# Altium schematic sheet УШЯИ.411618.029Э Э3 Лист 6new.schdoc
size 594 x 420 mm; SheetNumber: 6; SheetTotal: 7
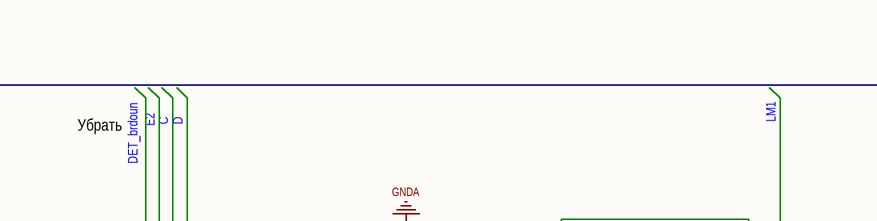
[diagram p0: УШЯИ.411618.029Э Э3 Лист 6new.schdoc, top right]
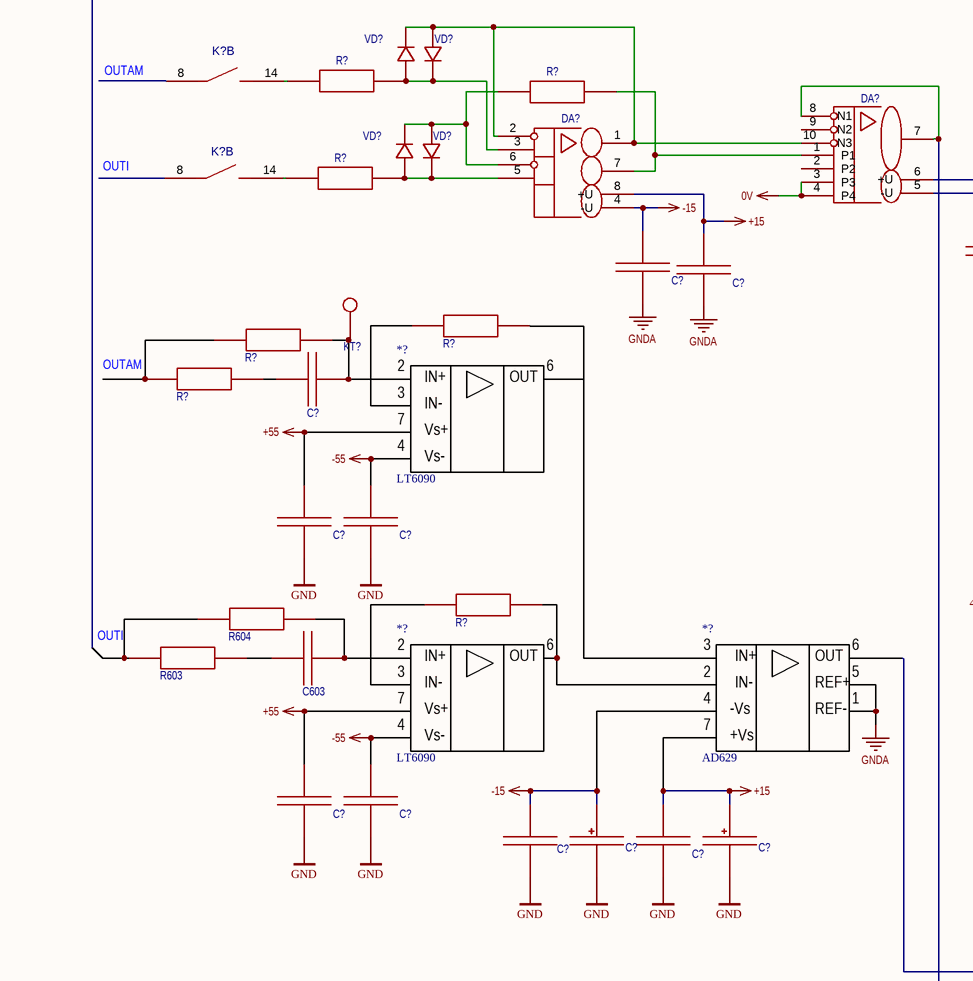
[diagram p1: УШЯИ.411618.029Э Э3 Лист 6new.schdoc, bottom left]
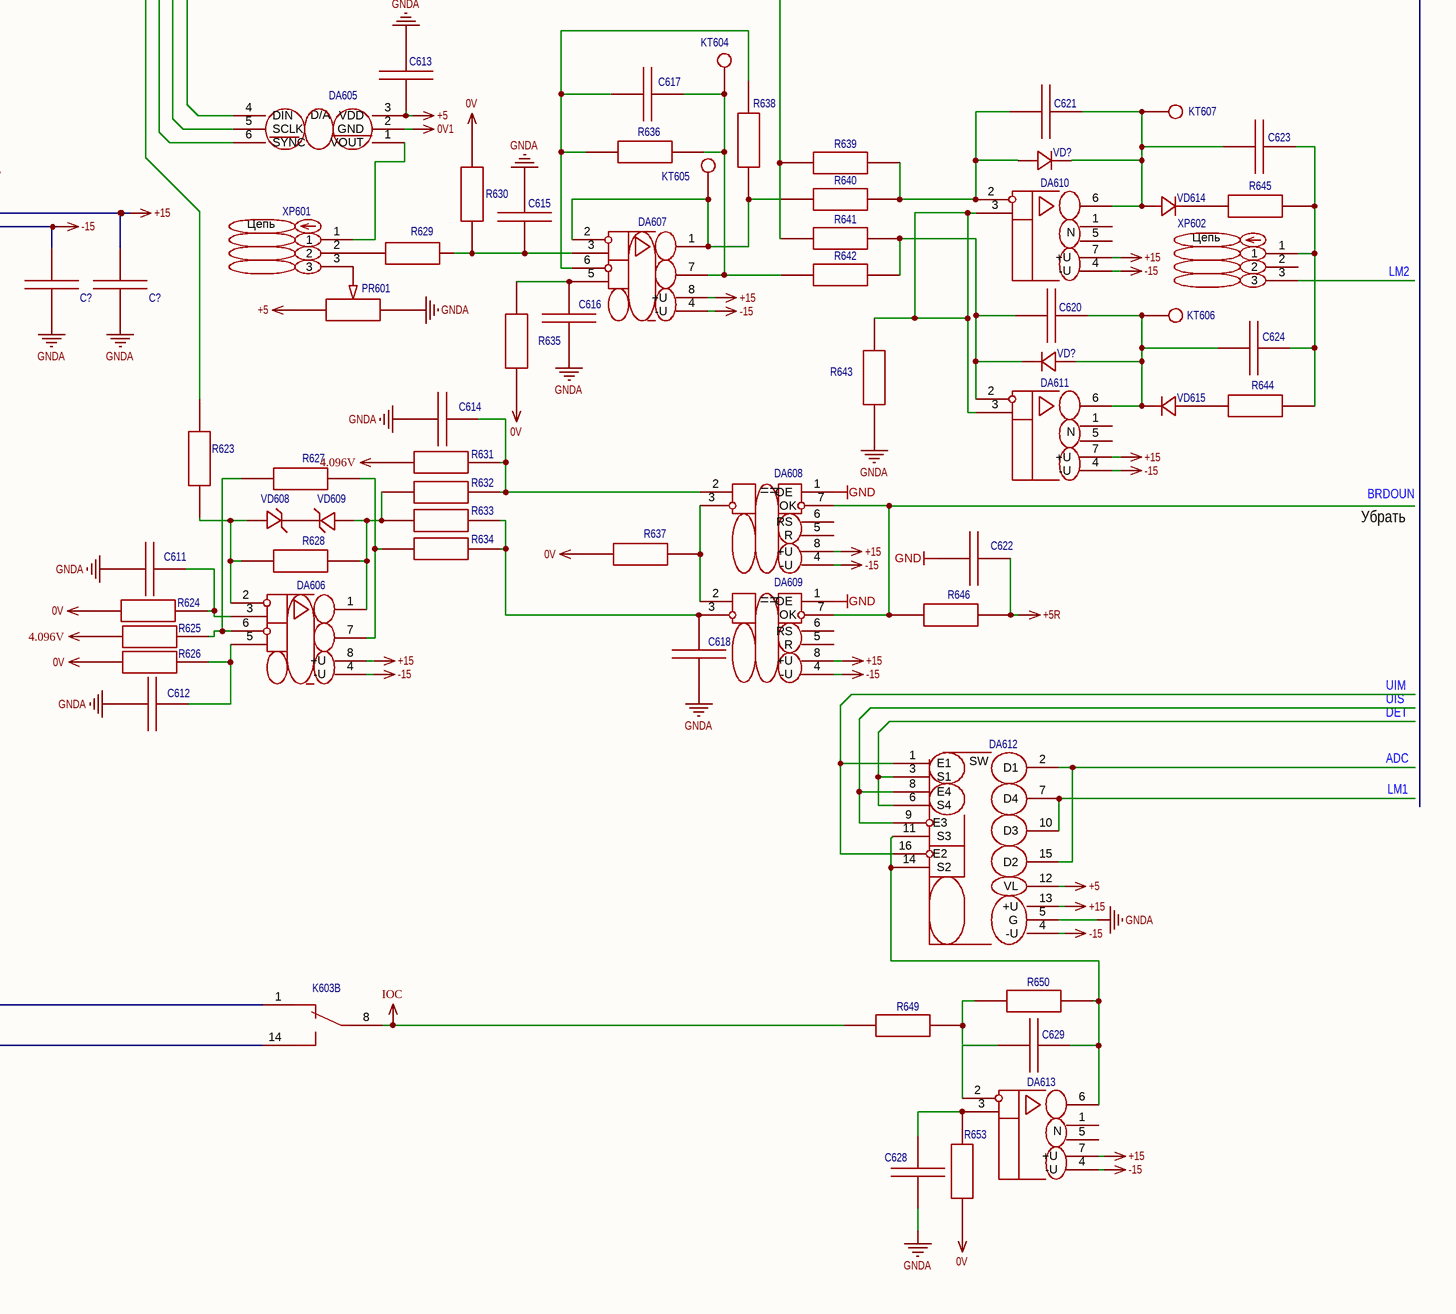
[diagram p2: УШЯИ.411618.029Э Э3 Лист 6new.schdoc, bottom right]

## Parts
(Parts that share a designator on the sheet are numbered #1, #2 ... from top to bottom, then left to right.)
*?#1  LT6090
*?#2  LT6090
*?#3  AD629
C603  Конденсатор SMD 15пФ 100В X7R 10% [0805]  [C0805]  (value not drawn)
C611  Конденсатор SMD 9100пФ 100В X7R 10% [1206]  [C0805]  (value not drawn)
C612  Конденсатор SMD 9100пФ 100В X7R 10% [1206]  [C0805]  (value not drawn)
C613  Конденсатор SMD 0,33мкФ 100В X7R 10% [0805]  [C0805]  (value not drawn)
C614  Конденсатор SMD 0,33мкФ 100В X7R 10% [0805]  [C0805]  (value not drawn)
C615  Конденсатор SMD 9100пФ 100В X7R 10% [0805]  [C0805]  (value not drawn)
C616  Конденсатор SMD 9100пФ 100В X7R 10% [0805]  [C0805]  (value not drawn)
C617  Конденсатор SMD 33пФ 100В X7R 10% [0805]  [C0805]  (value not drawn)
C618  Конденсатор SMD 9100пФ 100В X7R 10% [1206]  [C1206]  (value not drawn)
C620  Конденсатор SMD 680пФ 100В X7R 10% [0805]  [C0805]  (value not drawn)
C621  Конденсатор SMD 680пФ 100В X7R 10% [0805]  [C0805]  (value not drawn)
C622  Конденсатор SMD 0,33мкФ 100В X7R 10% [0805]  [C0805]  (value not drawn)
C623  Конденсатор SMD 100нФ В X7R 10% [0805]  [C0805]  (value not drawn)
C624  Конденсатор SMD 100нФ В X7R 10% [0805]  [C0805]  (value not drawn)
C628  Конденсатор SMD 51пФ 100В X7R 10% [0805]  [C0805]  (value not drawn)
C629  Конденсатор SMD 33пФ 100В X7R 10% [0805]  [C0805]  (value not drawn)
C?#1  Конденсатор SMD 0.1мкФ 100В X7R 10% [0805]  [C0805]  (value not drawn)
C?#2  Конденсатор SMD 0.1мкФ 100В X7R 10% [0805]  [C0805]  (value not drawn)
C?#3  Конденсатор SMD 0.1мкФ 100В X7R 10% [0805]  [C0805]  (value not drawn)
C?#4  Конденсатор SMD 0.1мкФ 100В X7R 10% [0805]  [C0805]  (value not drawn)
C?#5  Конденсатор SMD 15пФ 100В X7R 10% [0805]  [C0805]  (value not drawn)
C?#6  Конденсатор SMD 0.1мкФ 100В X7R 10% [0805]  [C0805]  (value not drawn)
C?#7  Конденсатор SMD 0.1мкФ 100В X7R 10% [0805]  [C0805]  (value not drawn)
C?#8  Конденсатор SMD 0.1мкФ 100В X7R 10% [0805]  [C0805]  (value not drawn)
C?#9  Конденсатор SMD 0.1мкФ 100В X7R 10% [0805]  [C0805]  (value not drawn)
C?#10  Конденсатор SMD 1мкФ 100В X7R 10% [0805]  [C0805]  (value not drawn)
C?#11  ECAP (К50-35), 10мкФ, 100В, 105°C, 5x11, p:2мм  [CAP-TH_BD5.0-P2.00-D0.8-FD]  (value not drawn)
C?#12  Конденсатор SMD 1мкФ 100В X7R 10% [0805]  [C0805]  (value not drawn)
C?#13  ECAP (К50-35), 10мкФ, 100В, 105°C, 5x11, p:2мм  [CAP-TH_BD5.0-P2.00-D0.8-FD]  (value not drawn)
DA605  Цифроаналоговый преобразователь AD5300BRTZ [SOT-23-6]  [SOT-23-6_L2.9-W1.6-P0.95-LS2.8-BL]  (value not drawn)
DA606  Операционный усилитель AD8672ARZ [SOIC-8]  [SOIC-8_L4.9-W3.9-P1.27-LS6.0-BL]  (value not drawn)
DA607  Операционный усилитель AD8672ARZ [SOIC-8]  [SOIC-8_L4.9-W3.9-P1.27-LS6.0-BL]  (value not drawn)
DA608  Компаратор КР554СА3А [DIP-8]  [DIP-8_L9.7-W6.4-P2.54-LS7.6-BL-1]  (value not drawn)
DA609  Компаратор КР554СА3А [DIP-8]  [DIP-8_L9.7-W6.4-P2.54-LS7.6-BL-1]  (value not drawn)
DA610  Операционный усилитель ADA4627-1BRZ [SOIC-8]  [SOIC-8_L5.0-W4.0-P1.27-LS6.1-BL]  (value not drawn)
DA611  Операционный усилитель ADA4627-1BRZ [SOIC-8]  [SOIC-8_L5.0-W4.0-P1.27-LS6.1-BL]  (value not drawn)
DA612  Коммутатор аналоговых сигналов ADG433BRZ [SOIC-16]  [SOIC-16_L9.9-W3.9-P1.27-LS6.0-BL]  (value not drawn)
DA613  Операционный усилитель ADA4627-1BRZ [SOIC-8]  [SOIC-8_L5.0-W4.0-P1.27-LS6.1-BL]  (value not drawn)
DA?#1  Операционный усилитель AD8271 [MSOP-10]  [MSOP-10_L3.0-W3.0-P0.50-LS5.0-BL]  (value not drawn)
DA?#2  Операционный усилитель AD8512ARZ [SOIC-8]  [SOIC-8_L4.9-W3.9-P1.27-LS6.0-BL]  (value not drawn)
K603  Реле герконовое DIP05-1C90-51L [PCB]  [Реле герконовое DIP05-1C90-51L [PCB]]  (value not drawn)  (part B of 2)
K?#1  Реле герконовое DIP05-1A72-13L  [PCB]  [Реле герконовое DIP05-1A72-13L  [PCB]]  (value not drawn)  (part B of 2)
K?#2  Реле герконовое DIP05-1A72-13L  [PCB]  [Реле герконовое DIP05-1A72-13L  [PCB]]  (value not drawn)  (part B of 2)
KT604  Control point  (value not drawn)
KT605  Control point  (value not drawn)
KT606  Control point  (value not drawn)
KT607  Control point  (value not drawn)
KT?  Control point  (value not drawn)
PR601  47кОм  [RES-ADJ-TH_3329H]  (value not drawn)
R603  Резистор 5,1кОм 0,125Вт 1% [0805]  [R0805]  (value not drawn)
R604  Резистор 301кОм 0.25Вт 1% [1206]  [R1206]  (value not drawn)
R623  Резистор 10кОм 0.25Вт 1% [1206]  [R1206]  (value not drawn)
R624  Резистор 10кОм 0.25Вт 1% [1206]  [R1206]  (value not drawn)
R625  Резистор 10кОм 0.25Вт 1% [1206]  [R1206]  (value not drawn)
R626  Резистор 10кОм 0.25Вт 1% [1206]  [R1206]  (value not drawn)
R627  Резистор 10кОм 0,125Вт 1% [0805]  [R0805]  (value not drawn)
R628  Резистор 10кОм 0,125Вт 1% [0805]  [R0805]  (value not drawn)
R629  Резистор 470Ом 0,125Вт 1% [0805]  [R0805]  (value not drawn)
R630  Резистор 12кОм 0,125Вт 1% [0805]  [R0805]  (value not drawn)
R631  Резистор 10кОм 0.25Вт 1% [1206]  [R1206]  (value not drawn)
R632  Резистор 17,2кОм 0.25Вт 1% [1206]  [R1206]  (value not drawn)
R633  Резистор 17,2кОм 0.25Вт 1% [1206]  [R1206]  (value not drawn)
R634  Резистор 10кОм 0.25Вт 1% [1206]  [R1206]  (value not drawn)
R635  Резистор 12кОм 0,125Вт 1% [0805]  [R0805]  (value not drawn)
R636  Резистор 10кОм 0.25Вт 1% [0805]  [R0805]  (value not drawn)
R637  Резистор 5,1кОм 0,125Вт 1% [0805]  [R0805]  (value not drawn)
R638  Резистор 10кОм 0.25Вт 1% [1206]  [R1206]  (value not drawn)
R639  Резистор 4,99кОм 0.25Вт 1% [1206]  [R1206]  (value not drawn)
R640  Резистор 10кОм 0.25Вт 1% [1206]  [R1206]  (value not drawn)
R641  Резистор 4,99кОм 0.25Вт 1% [1206]  [R1206]  (value not drawn)
R642  Резистор 10кОм 0.25Вт 1% [1206]  [R1206]  (value not drawn)
R643  Резистор 24кОм 0,125Вт 1% [0805]  [R0805]  (value not drawn)
R644  Резистор 4,7кОм 0,125Вт 1% [0805]  [R0805]  (value not drawn)
R645  Резистор 4,7кОм 0,125Вт 1% [0805]  [R0805]  (value not drawn)
R646  Резистор 12кОм 0,125Вт 1% [0805]  [R0805]  (value not drawn)
R649  Резистор 2кОм 0.25Вт 1% [1206]  [R1206]  (value not drawn)
R650  Резистор 2кОм 0.25Вт 1% [1206]  [R1206]  (value not drawn)
R653  Резистор 3,3кОм 0,125Вт 1% [0805]  [R0805]  (value not drawn)
R?#1  Резистор 300Ом 0,125Вт 1% [0805]  [R0805]  (value not drawn)
R?#2  Резистор 300Ом 0,125Вт 1% [0805]  [R0805]  (value not drawn)
R?#3  Резистор 300Ом 0,125Вт 1% [0805]  [R0805]  (value not drawn)
R?#4  Резистор 1кОм 0,125Вт 1% [0805]  [R0805]  (value not drawn)
R?#5  Резистор 301кОм 0.25Вт 1% [1206]  [R1206]  (value not drawn)
R?#6  Резистор 5,1кОм 0,125Вт 1% [0805]  [R0805]  (value not drawn)
R?#7  Резистор 1кОм 0,125Вт 1% [0805]  [R0805]  (value not drawn)
VD608  Стабилитрон MMSZ5223B 2.7В 0.5Вт [SOD123]  [SOD-123_L2.8-W1.8-LS3.7-RD]  (value not drawn)
VD609  Стабилитрон MMSZ5223B 2.7В 0.5Вт [SOD123]  [SOD-123_L2.8-W1.8-LS3.7-RD]  (value not drawn)
VD614  Диод импульсный 1N4448 [SOD-123]  [SOD-123_L2.7-W1.6-LS3.7-RD-1]  (value not drawn)
VD615  Диод импульсный 1N4448 [SOD-123]  [SOD-123_L2.7-W1.6-LS3.7-RD-1]  (value not drawn)
VD?#1  Диод JPAD50 [SOT-23]  [SOT-23-3_L3.0-W1.6-P1.90-LS2.8-L]  (value not drawn)
VD?#2  Диод JPAD50 [SOT-23]  [SOT-23-3_L3.0-W1.6-P1.90-LS2.8-L]  (value not drawn)
VD?#3  Диод импульсный 1N4448 [SOD-123]  [SOD-123_L2.7-W1.6-LS3.7-RD-1]  (value not drawn)
VD?#4  Диод JPAD50 [SOT-23]  [SOT-23-3_L3.0-W1.6-P1.90-LS2.8-L]  (value not drawn)
VD?#5  Диод JPAD50 [SOT-23]  [SOT-23-3_L3.0-W1.6-P1.90-LS2.8-L]  (value not drawn)
VD?#6  Диод импульсный 1N4448 [SOD-123]  [SOD-123_L2.7-W1.6-LS3.7-RD-1]  (value not drawn)
XP601  Вилка на плату 826629-3 шаг 2.54мм  [HDR-TH_3P-P2.54-V-M-1]  (value not drawn)
XP602  Вилка на плату 826629-3 шаг 2.54мм  [HDR-TH_3P-P2.54-V-M-1]  (value not drawn)

## Nets
0V: DA?#1.3(P3) DA?#1.4(P4) R624.1 R626.1 R630.2 R635.2 R637.2 R653.1
0V1: DA605.2(GND)
4.096V: R625.1 R631.1
+5: C613.1 DA605.3(VDD) DA612.12(VL) PR601.3
+5R: C622.2 R646.2
+15: *?#3.3 C?#2.1 C?#4.1 C?#12.1 C?#13.1 DA606.8(+U) DA607.8(+U) DA608.8(+U) DA609.8(+U) DA610.7(+U) DA611.7(+U) DA612.13(+U) DA613.7(+U) DA?#1.6(+U) DA?#2.8(+U)
+55: *?#1.13 *?#2.13 C?#6.1 C?#8.1
-15: *?#3.4 C?#1.1 C?#3.1 C?#10.1 C?#11.1 DA606.4(-U) DA607.4(-U) DA608.4(-U) DA609.4(-U) DA610.4(-U) DA611.4(-U) DA612.4(-U) DA613.4(-U) DA?#1.5(-U) DA?#2.4(-U)
-55: *?#1.14 *?#2.14 C?#7.1 C?#9.1
GND: C622.1 C?#6.2 C?#7.2 C?#8.2 C?#9.2 C?#10.2 C?#11.2 C?#12.2 C?#13.2 DA608.1(OE) DA609.1(OE)
GNDA: *?#3.1 *?#3.2 C611.1 C612.1 C613.2 C614.1 C615.2 C616.2 C618.1 C628.2 C?#1.2 C?#2.2 C?#3.2 C?#4.2 DA612.5(G) PR601.1 R643.2
IOC: K603.8 R649.2
ADC: DA612.2(D1) DA612.15(D2)
LM1: DA612.7(D4) DA612.10(D3) R639.1 R641.1
LM2: XP602.3
Net*?#1_7: *?#1.7 *?#3.6 R?#4.2
Net*?#1_11: *?#1.11 C?#5.1 KT?.1 R?#5.2
Net*?#1_12: *?#1.12 R?#4.1
Net*?#2_7: *?#2.7 *?#3.5 R?#7.2
Net*?#2_11: *?#2.11 C603.1 R604.2
Net*?#2_12: *?#2.12 R?#7.1
Net*?#3_0: *?#3.0 K603.1
NetC603_2: C603.2 R603.2
NetC611_2: C611.2 DA606.3(+IN) R624.2
NetC612_2: C612.2 DA606.5(+IN) R626.2
NetC614_2: C614.2 DA608.2 R631.2 R632.2
NetC615_1: C615.1 DA607.3(+IN) R629.2 R630.1
NetC616_1: C616.1 DA607.5(+IN) R635.1
NetC617_1: C617.1 DA607.7(OUT) KT604.1 R636.1 R642.1
NetC617_2: C617.2 DA607.6(-IN) R636.2 R638.2
NetC618_2: C618.2 DA609.3 R633.2 R634.2
NetC620_1: C620.1 DA611.2(-IN) R641.2 R642.2 VD?#6.1(C)
NetC620_2: C620.2 C624.2 DA611.6(OUT) KT606.1 VD615.1(C) VD?#6.2(A)
NetC621_1: C621.1 DA610.2(-IN) R639.2 R640.2 VD?#3.2(A)
NetC621_2: C621.2 C623.2 DA610.6(OUT) KT607.1 VD614.2(A) VD?#3.1(C)
NetC623_1: C623.1 C624.1 R644.1 R645.1 XP602.1
NetC628_1: C628.1 DA613.3(+IN) R653.2
NetC629_1: C629.1 DA613.2(-IN)
NetC629_2: C629.2 DA612.11(S3) DA612.14(S2) DA613.6(OUT) R650.1
NetC?#5_2: C?#5.2 R?#6.2
NetDA605_1: DA605.1(VOUT) XP601.1
NetDA606_1: DA606.1(OUT) R628.2 R632.1 R633.1 VD609.2(A)
NetDA606_2: DA606.2(-IN) R623.2 R628.1 VD608.2(A)
NetDA606_6: DA606.6(-IN) R625.2 R627.1
NetDA606_7: DA606.7(OUT) R627.2 R634.1
NetDA607_1: DA607.1(OUT) DA607.2(-IN) KT605.1 R638.1 R640.1
NetDA608_3: DA608.3 DA609.2 R637.1
NetDA608_7: DA608.7(OK) DA609.7(OK) R646.1
NetDA610_3: DA610.3(+IN) DA611.3(+IN) R643.1
NetDA612_1: DA612.1(E1) DA612.16(E2)
NetDA612_3: DA612.3(S1) DA612.6(S4)
NetDA612_8: DA612.8(E4) DA612.9(E3)
NetDA?#1_1: DA?#1.1(P1) DA?#2.7(OUT) R?#2.2
NetDA?#1_7: DA?#1.7(OUT) DA?#1.8(N1) K603.14
NetDA?#1_10: DA?#1.10(N3) DA?#2.1(OUT) DA?#2.2(-IN) VD?#1.3 VD?#2.1
NetDA?#2_3: DA?#2.3(+IN) R?#1.2 VD?#1.1 VD?#2.3
NetDA?#2_5: DA?#2.5(+IN) R?#3.2 VD?#4.1 VD?#5.3
NetDA?#2_6: DA?#2.6(-IN) R?#2.1 VD?#4.3 VD?#5.1
NetK?#1_14: K?#1.14 R?#1.1
NetK?#2_14: K?#2.14 R?#3.1
NetPR601_2: PR601.2 XP601.3
NetR603_1: R603.1 R604.1
NetR629_1: R629.1 XP601.2
NetR644_2: R644.2 VD615.2(A)
NetR645_2: R645.2 VD614.1(C)
NetR649_1: R649.1 R650.2
NetR?#5_1: R?#5.1 R?#6.1
NetVD608_1: VD608.1(K) VD609.1(K)

Not connected (* = marked no-connect by the designer): DA605 4(DIN) 5(SCLK) 6(SYNC); DA608 5(R) 6(RS); DA609 5(R) 6(RS); DA610 1(N) 5(N); DA611 1(N) 5(N); DA613 1(N) 5(N); DA?#1 2(P2) 9(N2); K?#1 8; K?#2 8; R623 1; XP602 2

## Notes on the sheet
- Убрать
- Labels drawn without touching a wire or pin: BRDOUN, DET_brdoun, OUTAM, OUTI
- Подп. и дата
- Инв.№ дубл.
- Взам.инв.№
- Подп.и дата
- Инв.№ подл.
- Изм.
- Лист
- № докум.
- Подп.
- Дата
- Формат  A2
- (in symbol AD629) IN+; OUT; IN-; REF+; -Vs; REF-; 7; +Vs
- (in symbol LT6090) 2; 6; IN+; OUT; 3; IN-; Vs+; 4; Vs-
- (in symbol Вилка на плату 826629-3 шаг 2.54мм) Цепь
- (in symbol Коммутатор аналоговых сигналов ADG433BRZ [SOIC-16]) SW
- (in symbol Цифроаналоговый преобразователь AD5300BRTZ [SOT-23-6]) D/A

## Library data of the parts
C603 C?#1-C?#9 = Конденсатор SMD 15пФ 100В X7R 10% [0805]: Contributor: jordanjin; Convert to PCB: yes; UniqueId: gge2181f9b3c6e2bb1e; Origin Footprint: C0805; Device: Конденсатор SMD 15пФ 100В X7R 10% [0805]; Symbol: Конденсатор SMD 15пФ 100В X7R 10% [0805]; Manufacturer Part: C0805; Add into BOM: yes; spicePre: C; spiceSymbolName: Конденсатор К10-17Б М47 33пФ NP0 5% [DIP]; FootprintName: C0805
C611 = Конденсатор SMD 9100пФ 100В X7R 10% [0805]: Contributor: jordanjin; Convert to PCB: yes; UniqueId: gged8c8c588d7ab512f; Origin Footprint: C0805; Device: Конденсатор SMD 9100пФ 100В X7R 10% [0805]; Symbol: Конденсатор SMD 9100пФ 100В X7R 10% [0805]; Manufacturer Part: C0805; spicePre: C; spiceSymbolName: Конденсатор SMD 100нФ 100В X7R 10% [0805]; Add into BOM: yes; FootprintName: C0805
C612 = Конденсатор SMD 9100пФ 100В X7R 10% [0805]: Contributor: jordanjin; Convert to PCB: yes; UniqueId: ggeea1fd01efbae17f5; Origin Footprint: C0805; Device: Конденсатор SMD 9100пФ 100В X7R 10% [0805]; Symbol: Конденсатор SMD 9100пФ 100В X7R 10% [0805]; Manufacturer Part: C0805; spicePre: C; spiceSymbolName: Конденсатор SMD 100нФ 100В X7R 10% [0805]; Add into BOM: yes; FootprintName: C0805
C613 = Конденсатор SMD 0,33мкФ 100В X7R 10% [0805]: Contributor: jordanjin; Convert to PCB: yes; UniqueId: gge11220b9d5fb08c95; Origin Footprint: C0805; Device: Конденсатор SMD 0,33мкФ 100В X7R 10% [0805]; Symbol: Конденсатор SMD 0,33мкФ 100В X7R 10% [0805]; Manufacturer Part: C0805; spicePre: C; spiceSymbolName: Конденсатор SMD 100нФ 100В X7R 10% [0805]; Add into BOM: yes; FootprintName: C0805
C614 = Конденсатор SMD 0,33мкФ 100В X7R 10% [0805]: Contributor: jordanjin; Convert to PCB: yes; UniqueId: gge1c8d724e312b948d; Origin Footprint: C0805; Device: Конденсатор SMD 0,33мкФ 100В X7R 10% [0805]; Symbol: Конденсатор SMD 0,33мкФ 100В X7R 10% [0805]; Manufacturer Part: C0805; spicePre: C; spiceSymbolName: Конденсатор SMD 100нФ 100В X7R 10% [0805]; Add into BOM: yes; FootprintName: C0805
C615 = Конденсатор SMD 9100пФ 100В X7R 10% [0805]: Contributor: jordanjin; Convert to PCB: yes; UniqueId: gge66e6ed0f0da9b8ab; Origin Footprint: C0805; Device: Конденсатор SMD 9100пФ 100В X7R 10% [0805]; Symbol: Конденсатор SMD 9100пФ 100В X7R 10% [0805]; Manufacturer Part: C0805; spicePre: C; spiceSymbolName: Конденсатор SMD 100нФ 100В X7R 10% [0805]; Add into BOM: yes; FootprintName: C0805
C616 = Конденсатор SMD 9100пФ 100В X7R 10% [0805]: Contributor: jordanjin; Convert to PCB: yes; UniqueId: ggebc9eb3afc720025c; Origin Footprint: C0805; Device: Конденсатор SMD 9100пФ 100В X7R 10% [0805]; Symbol: Конденсатор SMD 9100пФ 100В X7R 10% [0805]; Manufacturer Part: C0805; spicePre: C; spiceSymbolName: Конденсатор SMD 100нФ 100В X7R 10% [0805]; Add into BOM: yes; FootprintName: C0805
C617 = Конденсатор SMD 33пФ 100В X7R 10% [0805]: Contributor: jordanjin; Convert to PCB: yes; UniqueId: ggef83e3dbe73bcc716; Origin Footprint: C0805; Device: Конденсатор SMD 33пФ 100В X7R 10% [0805]; Symbol: Конденсатор SMD 33пФ 100В X7R 10% [0805]; Manufacturer Part: C0805; spicePre: C; spiceSymbolName: Конденсатор SMD 100нФ 100В X7R 10% [0805]; Add into BOM: yes; FootprintName: C0805
C618 = Конденсатор SMD 9100пФ 100В X7R 10% [0805]: Origin Footprint: C0805; Contributor: jordanjin; Convert to PCB: yes; UniqueId: gge7a02d01bed751451; Device: Конденсатор SMD 9100пФ 100В X7R 10% [0805]; Symbol: Конденсатор SMD 9100пФ 100В X7R 10% [0805]; Manufacturer Part: C0805; spicePre: C; spiceSymbolName: Конденсатор SMD 100нФ 100В X7R 10% [0805]; Add into BOM: yes; FootprintName: C0805
C620 = Конденсатор SMD 680пФ 100В X7R 10% [0805]: Contributor: jordanjin; Convert to PCB: yes; UniqueId: gge534c38f266f102c6; Origin Footprint: C0805; Device: Конденсатор SMD 680пФ 100В X7R 10% [0805]; Symbol: Конденсатор SMD 680пФ 100В X7R 10% [0805]; Manufacturer Part: C0805; spicePre: C; spiceSymbolName: Конденсатор SMD 100нФ 100В X7R 10% [0805]; Add into BOM: yes; FootprintName: C0805
C621 = Конденсатор SMD 680пФ 100В X7R 10% [0805]: Contributor: jordanjin; Convert to PCB: yes; UniqueId: gge9e5cd09579cbec99; Origin Footprint: C0805; Device: Конденсатор SMD 680пФ 100В X7R 10% [0805]; Symbol: Конденсатор SMD 680пФ 100В X7R 10% [0805]; Manufacturer Part: C0805; spicePre: C; spiceSymbolName: Конденсатор SMD 100нФ 100В X7R 10% [0805]; Add into BOM: yes; FootprintName: C0805
C622 = Конденсатор SMD 0,33мкФ 100В X7R 10% [0805]: Contributor: jordanjin; Convert to PCB: yes; UniqueId: ggec2a1fdf08b456d83; Origin Footprint: C0805; Device: Конденсатор SMD 0,33мкФ 100В X7R 10% [0805]; Symbol: Конденсатор SMD 0,33мкФ 100В X7R 10% [0805]; Manufacturer Part: C0805; spicePre: C; spiceSymbolName: Конденсатор SMD 100нФ 100В X7R 10% [0805]; Add into BOM: yes; FootprintName: C0805
C623 = Конденсатор SMD 100нФ В X7R 10% [0805]: Contributor: jordanjin; Convert to PCB: yes; UniqueId: gge516ca53ccaa11f5d; Origin Footprint: C0805; Device: Конденсатор SMD 100нФ В X7R 10% [0805]; Symbol: Конденсатор SMD 100нФ В X7R 10% [0805]; Manufacturer Part: C0805; spicePre: C; spiceSymbolName: Конденсатор SMD 100нФ 100В X7R 10% [0805]; Add into BOM: yes; FootprintName: C0805
C624 = Конденсатор SMD 100нФ В X7R 10% [0805]: Contributor: jordanjin; Convert to PCB: yes; UniqueId: gge64ab5350e3238cc7; Origin Footprint: C0805; Device: Конденсатор SMD 100нФ В X7R 10% [0805]; Symbol: Конденсатор SMD 100нФ В X7R 10% [0805]; Manufacturer Part: C0805; spicePre: C; spiceSymbolName: Конденсатор SMD 100нФ 100В X7R 10% [0805]; Add into BOM: yes; FootprintName: C0805
C628 = Конденсатор SMD 51пФ 100В X7R 10% [0805]: Contributor: jordanjin; Convert to PCB: yes; UniqueId: gge7c3d1d350e749c86; Origin Footprint: C0805; Device: Конденсатор SMD 51пФ 100В X7R 10% [0805]; Symbol: Конденсатор SMD 51пФ 100В X7R 10% [0805]; Manufacturer Part: C0805; Add into BOM: yes; spicePre: C; spiceSymbolName: Конденсатор SMD 100нФ 100В X7R 10% [0805]; FootprintName: C0805
C629 = Конденсатор SMD 33пФ 100В X7R 10% [0805]: Contributor: jordanjin; Convert to PCB: yes; UniqueId: gge2dcc97cb1bee371f; Origin Footprint: C0805; Device: Конденсатор SMD 33пФ 100В X7R 10% [0805]; Symbol: Конденсатор SMD 33пФ 100В X7R 10% [0805]; Manufacturer Part: C0805; Add into BOM: yes; spicePre: C; spiceSymbolName: Конденсатор SMD 100нФ 100В X7R 10% [0805]; FootprintName: C0805
C?#10 C?#12 = Конденсатор SMD 10пФ 100В X7R 10% [0805]: Contributor: jordanjin; Convert to PCB: yes; UniqueId: ggedef2608488099cc0; Origin Footprint: C0805; Device: Конденсатор SMD 10пФ 100В X7R 10% [0805]; Symbol: Конденсатор SMD 10пФ 100В X7R 10% [0805]; Manufacturer Part: C0805; spicePre: C; spiceSymbolName: Конденсатор SMD 100нФ 100В X7R 10% [0805]; Add into BOM: yes; FootprintName: C0805
C?#11 C?#13 = ECAP (К50-35), 4.7мкФ, 100В, 105°C, 5x11, p:2мм: Manufacturer: Chengx; nameAlias: Value; Contributor: jordanjin; Convert to PCB: yes; UniqueId: gge8b239ae06b28e32d; Origin Footprint: CAP-TH_BD5.0-P2.00-D0.8-FD; Device: ECAP (К50-35), 4.7мкФ, 100В, 105°C, 5x11, p:2мм; Symbol: ECAP (К50-35), 4.7мкФ, 100В, 105°C, 5x11, p:2мм; Supplier: LCSC; Manufacturer Part: ECAP (К50-35), 4.7мкФ, 100В, 105°C, 5x11, p:2мм; JLCPCB Part Class: Extended Part; spicePre: C; spiceSymbolName: ECAP (К50-35), 4.7мкФ, 100В, 105°C, 5x11, p:2мм; Add into BOM: yes; FootprintName: CAP-TH_BD5.0-P2.00-D0.8-FD
DA605 = Цифроаналоговый преобразователь AD5300BRTZ [SOT-23-6]: Manufacturer: Analog Devices; Manufacturer Part: AD5300BRTZ-REEL7; Contributor: jordanjin; Convert to PCB: yes; UniqueId: ggee9156f031132c62c; Origin Footprint: SOT-23-6_L2.9-W1.6-P0.95-LS2.8-BL; Device: Цифроаналоговый преобразователь AD5300BRTZ [SOT-23-6]; Symbol: Цифроаналоговый преобразователь AD5300BRTZ [SOT-23-6]; Supplier: LCSC; JLCPCB Part Class: Extended Part; spicePre: D; spiceSymbolName: Цифроаналоговый преобразователь AD5300BRTZ [SOT-23-6]; Add into BOM: yes; FootprintName: SOT-23-6_L2.9-W1.6-P0.95-LS2.8-BL
DA606 = Операционный усилитель AD8672ARZ [SOIC-8]: Manufacturer: Analog Devices; Manufacturer Part: AD8672ARZ-REEL7; Contributor: jordanjin; Convert to PCB: yes; UniqueId: gge6c9466a76004a78f; Origin Footprint: SOIC-8_L4.9-W3.9-P1.27-LS6.0-BL; Device: Операционный усилитель AD8672ARZ [SOIC-8]; Symbol: Операционный усилитель AD8672ARZ [SOIC-8]; Supplier: LCSC; Supplier Part: C56309; JLCPCB Part Class: Extended Part; spicePre: D; spiceSymbolName: Операционный усилитель AD8672ARZ [SOIC-8]; Add into BOM: yes; FootprintName: SOIC-8_L4.9-W3.9-P1.27-LS6.0-BL
DA607 = Операционный усилитель AD8672ARZ [SOIC-8]: Manufacturer: Analog Devices; Manufacturer Part: AD8672ARZ-REEL7; Contributor: jordanjin; Convert to PCB: yes; UniqueId: ggee6634572b7f12d52; Origin Footprint: SOIC-8_L4.9-W3.9-P1.27-LS6.0-BL; Device: Операционный усилитель AD8672ARZ [SOIC-8]; Symbol: Операционный усилитель AD8672ARZ [SOIC-8]; Supplier: LCSC; Supplier Part: C56309; JLCPCB Part Class: Extended Part; spicePre: D; spiceSymbolName: Операционный усилитель AD8672ARZ [SOIC-8]; Add into BOM: yes; FootprintName: SOIC-8_L4.9-W3.9-P1.27-LS6.0-BL
DA608 = Компаратор КР554СА3А [DIP-8]: Contributor: jordanjin; Convert to PCB: yes; UniqueId: gge40a82c4234872fa6; ModelId: a08c44e4e7b5483b85454123c2c7d395; Origin Footprint: DIP-8_L9.7-W6.4-P2.54-LS7.6-BL-1; Device: Компаратор КР554СА3А [DIP-8]; Symbol: Компаратор КР554СА3А [DIP-8]; Manufacturer Part: КР554СА3А; spicePre: D; spiceSymbolName: Компаратор КР554СА3А [DIP-8]; Add into BOM: yes; FootprintName: DIP-8_L9.7-W6.4-P2.54-LS7.6-BL-1; ModelName: DIP-8_L9.7-W6.4-P2.54-LS7.6-BL-1
DA609 = Компаратор КР554СА3А [DIP-8]: Contributor: jordanjin; Convert to PCB: yes; UniqueId: gged65ffbd1354557b5; ModelId: a08c44e4e7b5483b85454123c2c7d395; Origin Footprint: DIP-8_L9.7-W6.4-P2.54-LS7.6-BL-1; Device: Компаратор КР554СА3А [DIP-8]; Symbol: Компаратор КР554СА3А [DIP-8]; Manufacturer Part: КР554СА3А; spicePre: D; spiceSymbolName: Компаратор КР554СА3А [DIP-8]; Add into BOM: yes; FootprintName: DIP-8_L9.7-W6.4-P2.54-LS7.6-BL-1; ModelName: DIP-8_L9.7-W6.4-P2.54-LS7.6-BL-1
DA610 = Операционный усилитель ADA4627-1BRZ [SOIC-8]: Manufacturer: Analog Devices; Contributor: jordanjin; Convert to PCB: yes; UniqueId: gge8da6564329f396c6; ModelId: 08ee08ca4db744298953d7a1ad16709b; Origin Footprint: SOIC-8_L5.0-W4.0-P1.27-LS6.1-BL; Device: Операционный усилитель ADA4627-1BRZ [SOIC-8]; Symbol: Операционный усилитель ADA4627-1BRZ [SOIC-8]; Supplier: LCSC; Manufacturer Part: ADA4627-1BRZ; JLCPCB Part Class: Extended Part; spicePre: D; spiceSymbolName: Операционный усилитель ADA4627-1BRZ [SOIC-8]; Add into BOM: yes; FootprintName: SOIC-8_L5.0-W4.0-P1.27-LS6.1-BL; ModelName: SOIC-8_L5.0-W4.0-P1.27-LS6.1-BL
DA611 = Операционный усилитель ADA4627-1BRZ [SOIC-8]: Manufacturer: Analog Devices; Contributor: jordanjin; Convert to PCB: yes; UniqueId: ggeb3eaa57faad20ba4; ModelId: 08ee08ca4db744298953d7a1ad16709b; Origin Footprint: SOIC-8_L5.0-W4.0-P1.27-LS6.1-BL; Device: Операционный усилитель ADA4627-1BRZ [SOIC-8]; Symbol: Операционный усилитель ADA4627-1BRZ [SOIC-8]; Supplier: LCSC; Manufacturer Part: ADA4627-1BRZ; JLCPCB Part Class: Extended Part; spicePre: D; spiceSymbolName: Операционный усилитель ADA4627-1BRZ [SOIC-8]; Add into BOM: yes; FootprintName: SOIC-8_L5.0-W4.0-P1.27-LS6.1-BL; ModelName: SOIC-8_L5.0-W4.0-P1.27-LS6.1-BL
DA612 = Коммутатор аналоговых сигналов ADG433BRZ [SOIC-16]: Manufacturer: Analog Devices; Manufacturer Part: ADG433BRZ-REEL; Contributor: jordanjin; Convert to PCB: yes; UniqueId: gge8ed74c2802593459; Origin Footprint: SOIC-16_L9.9-W3.9-P1.27-LS6.0-BL; Device: Коммутатор аналоговых сигналов ADG433BRZ [SOIC-16]; Symbol: Коммутатор аналоговых сигналов ADG433BRZ [SOIC-16]; Supplier: LCSC; Supplier Part: C655338; JLCPCB Part Class: Extended Part; spicePre: D; spiceSymbolName: Коммутатор аналоговых сигналов ADG433BRZ [SOIC-16]; Add into BOM: yes; FootprintName: SOIC-16_L9.9-W3.9-P1.27-LS6.0-BL
DA613 = Операционный усилитель ADA4627-1BRZ [SOIC-8]: Manufacturer: Analog Devices; Contributor: jordanjin; Convert to PCB: yes; UniqueId: gge581cf98f1f47a8f1; ModelId: 08ee08ca4db744298953d7a1ad16709b; Origin Footprint: SOIC-8_L5.0-W4.0-P1.27-LS6.1-BL; Device: Операционный усилитель ADA4627-1BRZ [SOIC-8]; Symbol: Операционный усилитель ADA4627-1BRZ [SOIC-8]; Supplier: LCSC; Manufacturer Part: ADA4627-1BRZ; JLCPCB Part Class: Extended Part; spicePre: D; spiceSymbolName: Операционный усилитель ADA4627-1BRZ [SOIC-8]; Add into BOM: yes; FootprintName: SOIC-8_L5.0-W4.0-P1.27-LS6.1-BL; ModelName: SOIC-8_L5.0-W4.0-P1.27-LS6.1-BL
DA?#1 = Операционный усилитель AD8271 [MSOP-10]: Manufacturer: Analog Devices; Manufacturer Part: AD8271BRMZ; Contributor: jordanjin; Convert to PCB: yes; UniqueId: gge974dbd124a420eef; Origin Footprint: MSOP-10_L3.0-W3.0-P0.50-LS5.0-BL; Device: Операционный усилитель AD8271 [MSOP-10]; Symbol: Операционный усилитель AD8271 [MSOP-10]; Supplier: LCSC; JLCPCB Part Class: Extended Part; spicePre: D; spiceSymbolName: Операционный усилитель AD8271 [MSOP-10]; Add into BOM: yes; FootprintName: MSOP-10_L3.0-W3.0-P0.50-LS5.0-BL
DA?#2 = Операционный усилитель AD8512ARZ [SOIC-8]: subpart_no: 1; Manufacturer: Analog Devices; Contributor: jordanjin; Convert to PCB: yes; UniqueId: ggeced3b0461d8328b2; Origin Footprint: SOIC-8_L4.9-W3.9-P1.27-LS6.0-BL; Device: Операционный усилитель AD8512ARZ [SOIC-8]; Symbol: Операционный усилитель AD8512ARZ [SOIC-8]; Supplier: LCSC; Manufacturer Part: AD8512ARZ; JLCPCB Part Class: Extended Part; spicePre: D; spiceSymbolName: Операционный усилитель AD8512ARZ [SOIC-8]; Add into BOM: yes; FootprintName: SOIC-8_L4.9-W3.9-P1.27-LS6.0-BL
K603 = Реле герконовое DIP05-1C90-51L [PCB]: Manufacturer: STANDEXMEDER; subpart_no: 2; Origin Footprint: RELAY-TH_STANDEXMEDER_DIP05-1C90-51L; Contributor: jordanjin; Convert to PCB: yes; UniqueId: ggeb24c0cbb939d251f; ModelId: 9ce20f042c4243a9be1ebcff3b9f4bf9; Device: Реле герконовое DIP05-1C90-51L [PCB]; Symbol: Реле герконовое DIP05-1C90-51L [PCB]; Supplier: LCSC; Manufacturer Part: DIP05-1C90-51L; JLCPCB Part Class: Extended Part; spicePre: K; spiceSymbolName: Реле герконовое DIP05-1C90-51L [PCB]; Add into BOM: yes; FootprintName: RELAY-TH_STANDEXMEDER_DIP05-1C90-51L; ModelName: RELAY-TH_STANDEXMEDER_DIP05-1C90-51L
K?#1 = Реле герконовое DIP05-1A72-13L  [PCB]: Manufacturer: STANDEXMEDER; subpart_no: 2; Origin Footprint: RELAY-TH_STANDEXMEDER_DIP05-1A72-13L; Contributor: jordanjin; Convert to PCB: yes; UniqueId: gge51807c597b1384e9; Device: Реле герконовое DIP05-1A72-13L  [PCB]; Symbol: Реле герконовое DIP05-1A72-13L  [PCB]; Supplier: LCSC; Supplier Part: C1524853; Manufacturer Part: DIP05-1A72-13L; JLCPCB Part Class: Extended Part; spicePre: K; spiceSymbolName: Реле герконовое DIP05-1A72-13L  [PCB]; Add into BOM: yes; FootprintName: RELAY-TH_STANDEXMEDER_DIP05-1A72-13L
K?#2 = Реле герконовое DIP05-1A72-13L  [PCB]: Manufacturer: STANDEXMEDER; subpart_no: 1; Origin Footprint: RELAY-TH_STANDEXMEDER_DIP05-1A72-13L; Contributor: jordanjin; Convert to PCB: yes; UniqueId: gge52733196f8edc868; Device: Реле герконовое DIP05-1A72-13L  [PCB]; Symbol: Реле герконовое DIP05-1A72-13L  [PCB]; Supplier: LCSC; Supplier Part: C1524853; Manufacturer Part: DIP05-1A72-13L; JLCPCB Part Class: Extended Part; spicePre: K; spiceSymbolName: Реле герконовое DIP05-1A72-13L  [PCB]; Add into BOM: yes; FootprintName: RELAY-TH_STANDEXMEDER_DIP05-1A72-13L
KT604 = Control point: Contributor: jordanjin; Convert to PCB: yes; UniqueId: ggecff9ea9ceb979317; Origin Footprint: CONTROL POINT; Device: Control point; Symbol: Control point; Manufacturer Part: Control point; spicePre: K; spiceSymbolName: Control point; Add into BOM: yes
KT605 = Control point: Contributor: jordanjin; Convert to PCB: yes; UniqueId: gge4cd489995e175387; Origin Footprint: CONTROL POINT; Device: Control point; Symbol: Control point; Manufacturer Part: Control point; spicePre: K; spiceSymbolName: Control point; Add into BOM: yes
KT606 = Control point: Contributor: jordanjin; Convert to PCB: yes; UniqueId: ggeb14cbe2f1ff666e4; Origin Footprint: CONTROL POINT; Device: Control point; Symbol: Control point; Manufacturer Part: Control point; spicePre: K; spiceSymbolName: Control point; Add into BOM: yes
KT607 = Control point: Contributor: jordanjin; Convert to PCB: yes; UniqueId: ggea88355899b9db832; Origin Footprint: CONTROL POINT; Device: Control point; Symbol: Control point; Manufacturer Part: Control point; spicePre: K; spiceSymbolName: Control point; Add into BOM: yes
KT? = Control point: Contributor: jordanjin; Convert to PCB: yes; UniqueId: ggeff07f407c283f191; Origin Footprint: CONTROL POINT; Device: Control point; Symbol: Control point; Manufacturer Part: Control point; spicePre: K; spiceSymbolName: Control point; Add into BOM: yes
PR601 = 47кОм: Manufacturer: BOCHEN; Manufacturer Part: 3329H; nameAlias: Value; Contributor: jordanjin; Convert to PCB: yes; UniqueId: gge1fcb3b6f1d9b0ac2; ModelId: 23beb460a8f44fd4bbfb4488e320892f; Origin Footprint: RES-ADJ-TH_3329H; Device: 47кОм; Symbol: 47кОм; Supplier: LCSC; JLCPCB Part Class: Extended Part; spicePre: R; spiceSymbolName: Резистор подстроречный 47кОм [3329H]; Add into BOM: yes; Resistance: 47кОм; FootprintName: RES-ADJ-TH_3329H; ModelName: RES-ADJ-TH_3329H
R603 R?#4 R?#6 R?#7 = Резистор 5,1кОм 0,125Вт 1% [0805]: Contributor: jordanjin; Convert to PCB: yes; UniqueId: ggea61903ee3859a208; ModelId: de27d504f5024d53a3020ec2611f5e5e; Origin Footprint: R0805; Device: Резистор 5,1кОм 0,125Вт 1% [0805]; Symbol: Резистор 5,1кОм 0,125Вт 1% [0805]; Manufacturer Part: R0805; spicePre: R; spiceSymbolName: Резистор 12кОм 0,125Вт 1% [0805]; Add into BOM: yes; FootprintName: R0805; ModelName: R0805
R604 R?#5 = Резистор 301кОм 0.25Вт 1% [1206]: Contributor: jordanjin; Convert to PCB: yes; UniqueId: gge0e4eb32b7003baab; Origin Footprint: R1206; Device: Резистор 301кОм 0.25Вт 1% [1206]; Symbol: Резистор 301кОм 0.25Вт 1% [1206]; Manufacturer Part: R1206; spicePre: R; spiceSymbolName: Резистор 12кОм 0,25Вт 1% [1206]; Add into BOM: yes; FootprintName: R1206
R623 = Резистор 10кОм 0.25Вт 1% [1206]: Contributor: jordanjin; Convert to PCB: yes; UniqueId: gge3a5e4f79c35eb04d; Origin Footprint: R1206; Device: Резистор 10кОм 0.25Вт 1% [1206]; Symbol: Резистор 10кОм 0.25Вт 1% [1206]; Manufacturer Part: R1206; spicePre: R; spiceSymbolName: Резистор 12кОм 0,25Вт 1% [1206]; Add into BOM: yes; FootprintName: R1206
R624 = Резистор 10кОм 0.25Вт 1% [1206]: Contributor: jordanjin; Convert to PCB: yes; UniqueId: ggeb76d304dc5b48f4d; Origin Footprint: R1206; Device: Резистор 10кОм 0.25Вт 1% [1206]; Symbol: Резистор 10кОм 0.25Вт 1% [1206]; Manufacturer Part: R1206; spicePre: R; spiceSymbolName: Резистор 12кОм 0,25Вт 1% [1206]; Add into BOM: yes; FootprintName: R1206
R625 = Резистор 10кОм 0.25Вт 1% [1206]: Contributor: jordanjin; Convert to PCB: yes; UniqueId: ggeb5d5375cf7011a26; Origin Footprint: R1206; Device: Резистор 10кОм 0.25Вт 1% [1206]; Symbol: Резистор 10кОм 0.25Вт 1% [1206]; Manufacturer Part: R1206; spicePre: R; spiceSymbolName: Резистор 12кОм 0,25Вт 1% [1206]; Add into BOM: yes; FootprintName: R1206
R626 = Резистор 10кОм 0.25Вт 1% [1206]: Contributor: jordanjin; Convert to PCB: yes; UniqueId: ggecab7c1446fad6f63; Origin Footprint: R1206; Device: Резистор 10кОм 0.25Вт 1% [1206]; Symbol: Резистор 10кОм 0.25Вт 1% [1206]; Manufacturer Part: R1206; spicePre: R; spiceSymbolName: Резистор 12кОм 0,25Вт 1% [1206]; Add into BOM: yes; FootprintName: R1206
R627 = Резистор 10кОм 0,125Вт 1% [0805]: Contributor: jordanjin; Convert to PCB: yes; UniqueId: gge94d5b7a7d0576a3f; ModelId: de27d504f5024d53a3020ec2611f5e5e; Origin Footprint: R0805; Device: Резистор 10кОм 0,125Вт 1% [0805]; Symbol: Резистор 10кОм 0,125Вт 1% [0805]; Manufacturer Part: R0805; spicePre: R; spiceSymbolName: Резистор 12кОм 0,125Вт 1% [0805]; Add into BOM: yes; FootprintName: R0805; ModelName: R0805
R628 = Резистор 10кОм 0,125Вт 1% [0805]: Contributor: jordanjin; Convert to PCB: yes; UniqueId: gge73851368ca55a977; ModelId: de27d504f5024d53a3020ec2611f5e5e; Origin Footprint: R0805; Device: Резистор 10кОм 0,125Вт 1% [0805]; Symbol: Резистор 10кОм 0,125Вт 1% [0805]; Manufacturer Part: R0805; spicePre: R; spiceSymbolName: Резистор 12кОм 0,125Вт 1% [0805]; Add into BOM: yes; FootprintName: R0805; ModelName: R0805
R629 = Резистор 470Ом 0,125Вт 1% [0805]: Contributor: jordanjin; Convert to PCB: yes; UniqueId: ggeb874a8de55068fb4; ModelId: de27d504f5024d53a3020ec2611f5e5e; Origin Footprint: R0805; Device: Резистор 470Ом 0,125Вт 1% [0805]; Symbol: Резистор 470Ом 0,125Вт 1% [0805]; Manufacturer Part: R0805; spicePre: R; spiceSymbolName: Резистор 12кОм 0,125Вт 1% [0805]; Add into BOM: yes; FootprintName: R0805; ModelName: R0805
R630 = Резистор 12кОм 0,125Вт 1% [0805]: Contributor: jordanjin; Convert to PCB: yes; UniqueId: ggecb19d0140942bf66; ModelId: de27d504f5024d53a3020ec2611f5e5e; Origin Footprint: R0805; Device: Резистор 12кОм 0,125Вт 1% [0805]; Symbol: Резистор 12кОм 0,125Вт 1% [0805]; Manufacturer Part: R0805; spicePre: R; spiceSymbolName: Резистор 12кОм 0,125Вт 1% [0805]; Add into BOM: yes; FootprintName: R0805; ModelName: R0805
R631 = Резистор 10кОм 0.25Вт 1% [1206]: Contributor: jordanjin; Convert to PCB: yes; UniqueId: gged6763fe3c6df9c5a; Origin Footprint: R1206; Device: Резистор 10кОм 0.25Вт 1% [1206]; Symbol: Резистор 10кОм 0.25Вт 1% [1206]; Manufacturer Part: R1206; spicePre: R; spiceSymbolName: Резистор 12кОм 0,25Вт 1% [1206]; Add into BOM: yes; FootprintName: R1206
R632 = Резистор 17,2кОм 0.25Вт 1% [1206]: Contributor: jordanjin; Convert to PCB: yes; UniqueId: ggedcd04cdd6fcbb72e; Origin Footprint: R1206; Device: Резистор 17,2кОм 0.25Вт 1% [1206]; Symbol: Резистор 17,2кОм 0.25Вт 1% [1206]; Manufacturer Part: R1206; spicePre: R; spiceSymbolName: Резистор 12кОм 0,25Вт 1% [1206]; Add into BOM: yes; FootprintName: R1206
R633 = Резистор 17,2кОм 0.25Вт 1% [1206]: Contributor: jordanjin; Convert to PCB: yes; UniqueId: gge9547ec5fb58540ec; Origin Footprint: R1206; Device: Резистор 17,2кОм 0.25Вт 1% [1206]; Symbol: Резистор 17,2кОм 0.25Вт 1% [1206]; Manufacturer Part: R1206; spicePre: R; spiceSymbolName: Резистор 12кОм 0,25Вт 1% [1206]; Add into BOM: yes; FootprintName: R1206
R634 = Резистор 10кОм 0.25Вт 1% [1206]: Contributor: jordanjin; Convert to PCB: yes; UniqueId: gge3b738eddb21e4e76; Origin Footprint: R1206; Device: Резистор 10кОм 0.25Вт 1% [1206]; Symbol: Резистор 10кОм 0.25Вт 1% [1206]; Manufacturer Part: R1206; spicePre: R; spiceSymbolName: Резистор 12кОм 0,25Вт 1% [1206]; Add into BOM: yes; FootprintName: R1206
R635 = Резистор 12кОм 0,125Вт 1% [0805]: Contributor: jordanjin; Convert to PCB: yes; UniqueId: gge67e268b3363a8ed4; ModelId: de27d504f5024d53a3020ec2611f5e5e; Origin Footprint: R0805; Device: Резистор 12кОм 0,125Вт 1% [0805]; Symbol: Резистор 12кОм 0,125Вт 1% [0805]; Manufacturer Part: R0805; spicePre: R; spiceSymbolName: Резистор 12кОм 0,125Вт 1% [0805]; Add into BOM: yes; FootprintName: R0805; ModelName: R0805
R636 = Резистор 10кОм 0.25Вт 1% [0805]: Contributor: jordanjin; Convert to PCB: yes; UniqueId: ggeb22dc21734e2a0a2; ModelId: de27d504f5024d53a3020ec2611f5e5e; Origin Footprint: R0805; Device: Резистор 10кОм 0.25Вт 1% [0805]; Symbol: Резистор 10кОм 0.25Вт 1% [0805]; Manufacturer Part: R0805; spicePre: R; spiceSymbolName: Резистор 12кОм 0,125Вт 1% [0805]; Add into BOM: yes; FootprintName: R0805; ModelName: R0805
R637 = Резистор 5,1кОм 0,125Вт 1% [0805]: Contributor: jordanjin; Convert to PCB: yes; UniqueId: gge29fbb60ab5c47728; ModelId: de27d504f5024d53a3020ec2611f5e5e; Origin Footprint: R0805; Device: Резистор 5,1кОм 0,125Вт 1% [0805]; Symbol: Резистор 5,1кОм 0,125Вт 1% [0805]; Manufacturer Part: R0805; spicePre: R; spiceSymbolName: Резистор 12кОм 0,125Вт 1% [0805]; Add into BOM: yes; FootprintName: R0805; ModelName: R0805
R638 = Резистор 10кОм 0.25Вт 1% [1206]: Contributor: jordanjin; Convert to PCB: yes; UniqueId: gge85a598c3af7ed5d4; Origin Footprint: R1206; Device: Резистор 10кОм 0.25Вт 1% [1206]; Symbol: Резистор 10кОм 0.25Вт 1% [1206]; Manufacturer Part: R1206; spicePre: R; spiceSymbolName: Резистор 12кОм 0,25Вт 1% [1206]; Add into BOM: yes; FootprintName: R1206
R639 = Резистор 4,99кОм 0.25Вт 1% [1206]: Contributor: jordanjin; Convert to PCB: yes; UniqueId: ggec424db209df0ef33; Origin Footprint: R1206; Device: Резистор 4,99кОм 0.25Вт 1% [1206]; Symbol: Резистор 4,99кОм 0.25Вт 1% [1206]; Manufacturer Part: R1206; spicePre: R; spiceSymbolName: Резистор 12кОм 0,25Вт 1% [1206]; Add into BOM: yes; FootprintName: R1206
R640 = Резистор 10кОм 0.25Вт 1% [1206]: Contributor: jordanjin; Convert to PCB: yes; UniqueId: gge924e646db2c26990; Origin Footprint: R1206; Device: Резистор 10кОм 0.25Вт 1% [1206]; Symbol: Резистор 10кОм 0.25Вт 1% [1206]; Manufacturer Part: R1206; spicePre: R; spiceSymbolName: Резистор 12кОм 0,25Вт 1% [1206]; Add into BOM: yes; FootprintName: R1206
R641 = Резистор 4,99кОм 0.25Вт 1% [1206]: Contributor: jordanjin; Convert to PCB: yes; UniqueId: ggee44ca5bbd1f4fb17; Origin Footprint: R1206; Device: Резистор 4,99кОм 0.25Вт 1% [1206]; Symbol: Резистор 4,99кОм 0.25Вт 1% [1206]; Manufacturer Part: R1206; spicePre: R; spiceSymbolName: Резистор 12кОм 0,25Вт 1% [1206]; Add into BOM: yes; FootprintName: R1206
R642 = Резистор 10кОм 0.25Вт 1% [1206]: Contributor: jordanjin; Convert to PCB: yes; UniqueId: gge4426f4b245fcb0be; Origin Footprint: R1206; Device: Резистор 10кОм 0.25Вт 1% [1206]; Symbol: Резистор 10кОм 0.25Вт 1% [1206]; Manufacturer Part: R1206; spicePre: R; spiceSymbolName: Резистор 12кОм 0,25Вт 1% [1206]; Add into BOM: yes; FootprintName: R1206
R643 = Резистор 24кОм 0,125Вт 1% [0805]: Contributor: jordanjin; Convert to PCB: yes; UniqueId: gge44f9e0f9b301705b; ModelId: de27d504f5024d53a3020ec2611f5e5e; Origin Footprint: R0805; Device: Резистор 24кОм 0,125Вт 1% [0805]; Symbol: Резистор 24кОм 0,125Вт 1% [0805]; Manufacturer Part: R0805; spicePre: R; spiceSymbolName: Резистор 12кОм 0,125Вт 1% [0805]; Add into BOM: yes; FootprintName: R0805; ModelName: R0805
R644 = Резистор 4,7кОм 0,125Вт 1% [0805]: Contributor: jordanjin; Convert to PCB: yes; UniqueId: gge3359f44cd81f3719; ModelId: de27d504f5024d53a3020ec2611f5e5e; Origin Footprint: R0805; Device: Резистор 4,7кОм 0,125Вт 1% [0805]; Symbol: Резистор 4,7кОм 0,125Вт 1% [0805]; Manufacturer Part: R0805; spicePre: R; spiceSymbolName: Резистор 12кОм 0,125Вт 1% [0805]; Add into BOM: yes; FootprintName: R0805; ModelName: R0805
R645 = Резистор 4,7кОм 0,125Вт 1% [0805]: Contributor: jordanjin; Convert to PCB: yes; UniqueId: ggeec23f9db4922fe85; ModelId: de27d504f5024d53a3020ec2611f5e5e; Origin Footprint: R0805; Device: Резистор 4,7кОм 0,125Вт 1% [0805]; Symbol: Резистор 4,7кОм 0,125Вт 1% [0805]; Manufacturer Part: R0805; spicePre: R; spiceSymbolName: Резистор 12кОм 0,125Вт 1% [0805]; Add into BOM: yes; FootprintName: R0805; ModelName: R0805
R646 = Резистор 12кОм 0,125Вт 1% [0805]: Contributor: jordanjin; Convert to PCB: yes; UniqueId: gge39fe5661104f6394; ModelId: de27d504f5024d53a3020ec2611f5e5e; Origin Footprint: R0805; Device: Резистор 12кОм 0,125Вт 1% [0805]; Symbol: Резистор 12кОм 0,125Вт 1% [0805]; Manufacturer Part: R0805; spicePre: R; spiceSymbolName: Резистор 12кОм 0,125Вт 1% [0805]; Add into BOM: yes; FootprintName: R0805; ModelName: R0805
R649 = Резистор 2кОм 0.25Вт 1% [1206]: Contributor: jordanjin; Convert to PCB: yes; UniqueId: gge82e20d64e8814dd7; Origin Footprint: R1206; Device: Резистор 2кОм 0.25Вт 1% [1206]; Symbol: Резистор 2кОм 0.25Вт 1% [1206]; Manufacturer Part: R1206; spicePre: R; spiceSymbolName: Резистор 12кОм 0,25Вт 1% [1206]; Add into BOM: yes; FootprintName: R1206
R650 = Резистор 2кОм 0.25Вт 1% [1206]: Contributor: jordanjin; Convert to PCB: yes; UniqueId: ggea6a906233ad70946; Origin Footprint: R1206; Device: Резистор 2кОм 0.25Вт 1% [1206]; Symbol: Резистор 2кОм 0.25Вт 1% [1206]; Manufacturer Part: R1206; spicePre: R; spiceSymbolName: Резистор 12кОм 0,25Вт 1% [1206]; Add into BOM: yes; FootprintName: R1206
R653 = Резистор 3,3кОм 0,125Вт 1% [0805]: Contributor: jordanjin; Convert to PCB: yes; UniqueId: ggeb9ffcc920bf386fb; ModelId: de27d504f5024d53a3020ec2611f5e5e; Origin Footprint: R0805; Device: Резистор 3,3кОм 0,125Вт 1% [0805]; Symbol: Резистор 3,3кОм 0,125Вт 1% [0805]; Manufacturer Part: R0805; spicePre: R; spiceSymbolName: Резистор 12кОм 0,125Вт 1% [0805]; Add into BOM: yes; FootprintName: R0805; ModelName: R0805
R?#1 = Резистор 300Ом 0,125Вт 1% [0805]: Contributor: jordanjin; Convert to PCB: yes; UniqueId: ggec2909b7a38843847; ModelId: de27d504f5024d53a3020ec2611f5e5e; Origin Footprint: R0805; Device: Резистор 300Ом 0,125Вт 1% [0805]; Symbol: Резистор 300Ом 0,125Вт 1% [0805]; Manufacturer Part: R0805; spicePre: R; spiceSymbolName: Резистор 12кОм 0,125Вт 1% [0805]; Add into BOM: yes; FootprintName: R0805; ModelName: R0805
R?#2 = Резистор 300Ом 0,125Вт 1% [0805]: Contributor: jordanjin; Convert to PCB: yes; UniqueId: ggec87826da4cfd183e; ModelId: de27d504f5024d53a3020ec2611f5e5e; Origin Footprint: R0805; Device: Резистор 300Ом 0,125Вт 1% [0805]; Symbol: Резистор 300Ом 0,125Вт 1% [0805]; Manufacturer Part: R0805; spicePre: R; spiceSymbolName: Резистор 12кОм 0,125Вт 1% [0805]; Add into BOM: yes; FootprintName: R0805; ModelName: R0805
R?#3 = Резистор 300Ом 0,125Вт 1% [0805]: Contributor: jordanjin; Convert to PCB: yes; UniqueId: gge72d79cb2dc0caeeb; ModelId: de27d504f5024d53a3020ec2611f5e5e; Origin Footprint: R0805; Device: Резистор 300Ом 0,125Вт 1% [0805]; Symbol: Резистор 300Ом 0,125Вт 1% [0805]; Manufacturer Part: R0805; spicePre: R; spiceSymbolName: Резистор 12кОм 0,125Вт 1% [0805]; Add into BOM: yes; FootprintName: R0805; ModelName: R0805
VD608 = Стабилитрон MMSZ5223B 2.7В 0.5Вт [SOD123]: Manufacturer: CJ; Convert to PCB: yes; UniqueId: ggeed0908ba25f18c6a; ModelId: 560a7cf99d0e44cb9af362aaf5d7923d; Origin Footprint: SOD-123_L2.8-W1.8-LS3.7-RD; Device: Стабилитрон MMSZ5223B 2.7В 0.5Вт [SOD123]; Symbol: Стабилитрон MMSZ5223B 2.7В 0.5Вт [SOD123]; Supplier: LCSC; Manufacturer Part: MMSZ5223B; Supplier Part: C21556; JLCPCB Part Class: Extended Part; spicePre: Z; spiceSymbolName: MMSZ5234B; Add into BOM: yes; FootprintName: SOD-123_L2.8-W1.8-LS3.7-RD; ModelName: SOD-123_L2.8-W1.8-LS3.7-RD
VD609 = Стабилитрон MMSZ5223B 2.7В 0.5Вт [SOD123]: Manufacturer: CJ; Convert to PCB: yes; UniqueId: gge75b600da1a7e87a0; ModelId: 560a7cf99d0e44cb9af362aaf5d7923d; Origin Footprint: SOD-123_L2.8-W1.8-LS3.7-RD; Device: Стабилитрон MMSZ5223B 2.7В 0.5Вт [SOD123]; Symbol: Стабилитрон MMSZ5223B 2.7В 0.5Вт [SOD123]; Supplier: LCSC; Manufacturer Part: MMSZ5223B; Supplier Part: C21556; JLCPCB Part Class: Extended Part; spicePre: Z; spiceSymbolName: MMSZ5234B; Add into BOM: yes; FootprintName: SOD-123_L2.8-W1.8-LS3.7-RD; ModelName: SOD-123_L2.8-W1.8-LS3.7-RD
VD614 VD?#3 = Диод импульсный 1N4448 [SOD-123]: Manufacturer: YANGJIE; Manufacturer Part: 1N4448WQ; Contributor: jordanjin; Convert to PCB: yes; UniqueId: gge37c816c3320bdafc; ModelId: 5a61cd31046d4447ba73169a45a0935b; Origin Footprint: SOD-123_L2.7-W1.6-LS3.7-RD-1; Device: Диод импульсный 1N4448 [SOD-123]; Symbol: Диод импульсный 1N4448 [SOD-123]; Supplier: LCSC; JLCPCB Part Class: Extended Part; spicePre: V; spiceSymbolName: Диод импульсный 1N4448 [SOD-123]; Add into BOM: yes; FootprintName: SOD-123_L2.7-W1.6-LS3.7-RD-1; ModelName: SOD-123_L2.7-W1.6-LS3.7-RD-1
VD615 VD?#6 = Диод импульсный 1N4448 [SOD-123]: Manufacturer: YANGJIE; Manufacturer Part: 1N4448WQ; Contributor: jordanjin; Convert to PCB: yes; UniqueId: gge04314e08350ec828; ModelId: 5a61cd31046d4447ba73169a45a0935b; Origin Footprint: SOD-123_L2.7-W1.6-LS3.7-RD-1; Device: Диод импульсный 1N4448 [SOD-123]; Symbol: Диод импульсный 1N4448 [SOD-123]; Supplier: LCSC; JLCPCB Part Class: Extended Part; spicePre: V; spiceSymbolName: Диод импульсный 1N4448 [SOD-123]; Add into BOM: yes; FootprintName: SOD-123_L2.7-W1.6-LS3.7-RD-1; ModelName: SOD-123_L2.7-W1.6-LS3.7-RD-1
VD?#1 = Диод JPAD50 [SOT-23]: Manufacturer: Calogic; Contributor: jordanjin; Convert to PCB: yes; UniqueId: gge95b610f2389dff5a; ModelId: b6ca209a251f42989336735ebf9446b9; Origin Footprint: SOT-23-3_L3.0-W1.6-P1.90-LS2.8-L; Device: Диод JPAD50 [SOT-23]; Symbol: Диод JPAD50 [SOT-23]; Supplier: LCSC; Manufacturer Part: JPAD50; JLCPCB Part Class: Extended Part; spicePre: V; spiceSymbolName: Диод JPAD50 [SOT-23]; Add into BOM: yes; FootprintName: SOT-23-3_L3.0-W1.6-P1.90-LS2.8-L; ModelName: SOT-23-3_L3.0-W1.6-P1.90-LS2.8-L
VD?#2 = Диод JPAD50 [SOT-23]: Manufacturer: Calogic; Contributor: jordanjin; Convert to PCB: yes; UniqueId: gge11367b5b4a96ccef; ModelId: b6ca209a251f42989336735ebf9446b9; Origin Footprint: SOT-23-3_L3.0-W1.6-P1.90-LS2.8-L; Device: Диод JPAD50 [SOT-23]; Symbol: Диод JPAD50 [SOT-23]; Supplier: LCSC; Manufacturer Part: JPAD50; JLCPCB Part Class: Extended Part; spicePre: V; spiceSymbolName: Диод JPAD50 [SOT-23]; Add into BOM: yes; FootprintName: SOT-23-3_L3.0-W1.6-P1.90-LS2.8-L; ModelName: SOT-23-3_L3.0-W1.6-P1.90-LS2.8-L
VD?#4 = Диод JPAD50 [SOT-23]: Manufacturer: Calogic; Contributor: jordanjin; Convert to PCB: yes; UniqueId: gge598c18b5ecf44853; ModelId: b6ca209a251f42989336735ebf9446b9; Origin Footprint: SOT-23-3_L3.0-W1.6-P1.90-LS2.8-L; Device: Диод JPAD50 [SOT-23]; Symbol: Диод JPAD50 [SOT-23]; Supplier: LCSC; Manufacturer Part: JPAD50; JLCPCB Part Class: Extended Part; spicePre: V; spiceSymbolName: Диод JPAD50 [SOT-23]; Add into BOM: yes; FootprintName: SOT-23-3_L3.0-W1.6-P1.90-LS2.8-L; ModelName: SOT-23-3_L3.0-W1.6-P1.90-LS2.8-L
VD?#5 = Диод JPAD50 [SOT-23]: Manufacturer: Calogic; Contributor: jordanjin; Convert to PCB: yes; UniqueId: gge2e68016ab3ca0836; ModelId: b6ca209a251f42989336735ebf9446b9; Origin Footprint: SOT-23-3_L3.0-W1.6-P1.90-LS2.8-L; Device: Диод JPAD50 [SOT-23]; Symbol: Диод JPAD50 [SOT-23]; Supplier: LCSC; Manufacturer Part: JPAD50; JLCPCB Part Class: Extended Part; spicePre: V; spiceSymbolName: Диод JPAD50 [SOT-23]; Add into BOM: yes; FootprintName: SOT-23-3_L3.0-W1.6-P1.90-LS2.8-L; ModelName: SOT-23-3_L3.0-W1.6-P1.90-LS2.8-L
XP601 = Вилка на плату 826629-3 шаг 2.54мм: Manufacturer: TE Connectivity; Contributor: jordanjin; Convert to PCB: yes; UniqueId: gge545ccd5247932dd5; Origin Footprint: HDR-TH_3P-P2.54-V-M-1; Device: Вилка на плату 826629-3 шаг 2.54мм; Symbol: Вилка на плату 826629-3 шаг 2.54мм; Supplier: LCSC; Manufacturer Part: 826629-3; JLCPCB Part Class: Extended Part; spicePre: X; spiceSymbolName: Вилка на плату 826629-3 шаг 2.54мм; Add into BOM: yes; FootprintName: HDR-TH_3P-P2.54-V-M-1
XP602 = Вилка на плату 826629-3 шаг 2.54мм: Manufacturer: TE Connectivity; Contributor: jordanjin; Convert to PCB: yes; UniqueId: ggefae9065540a3e46c; Origin Footprint: HDR-TH_3P-P2.54-V-M-1; Device: Вилка на плату 826629-3 шаг 2.54мм; Symbol: Вилка на плату 826629-3 шаг 2.54мм; Supplier: LCSC; Manufacturer Part: 826629-3; JLCPCB Part Class: Extended Part; spicePre: X; spiceSymbolName: Вилка на плату 826629-3 шаг 2.54мм; Add into BOM: yes; FootprintName: HDR-TH_3P-P2.54-V-M-1